# Altium project smart_pill_box.PrjPcb
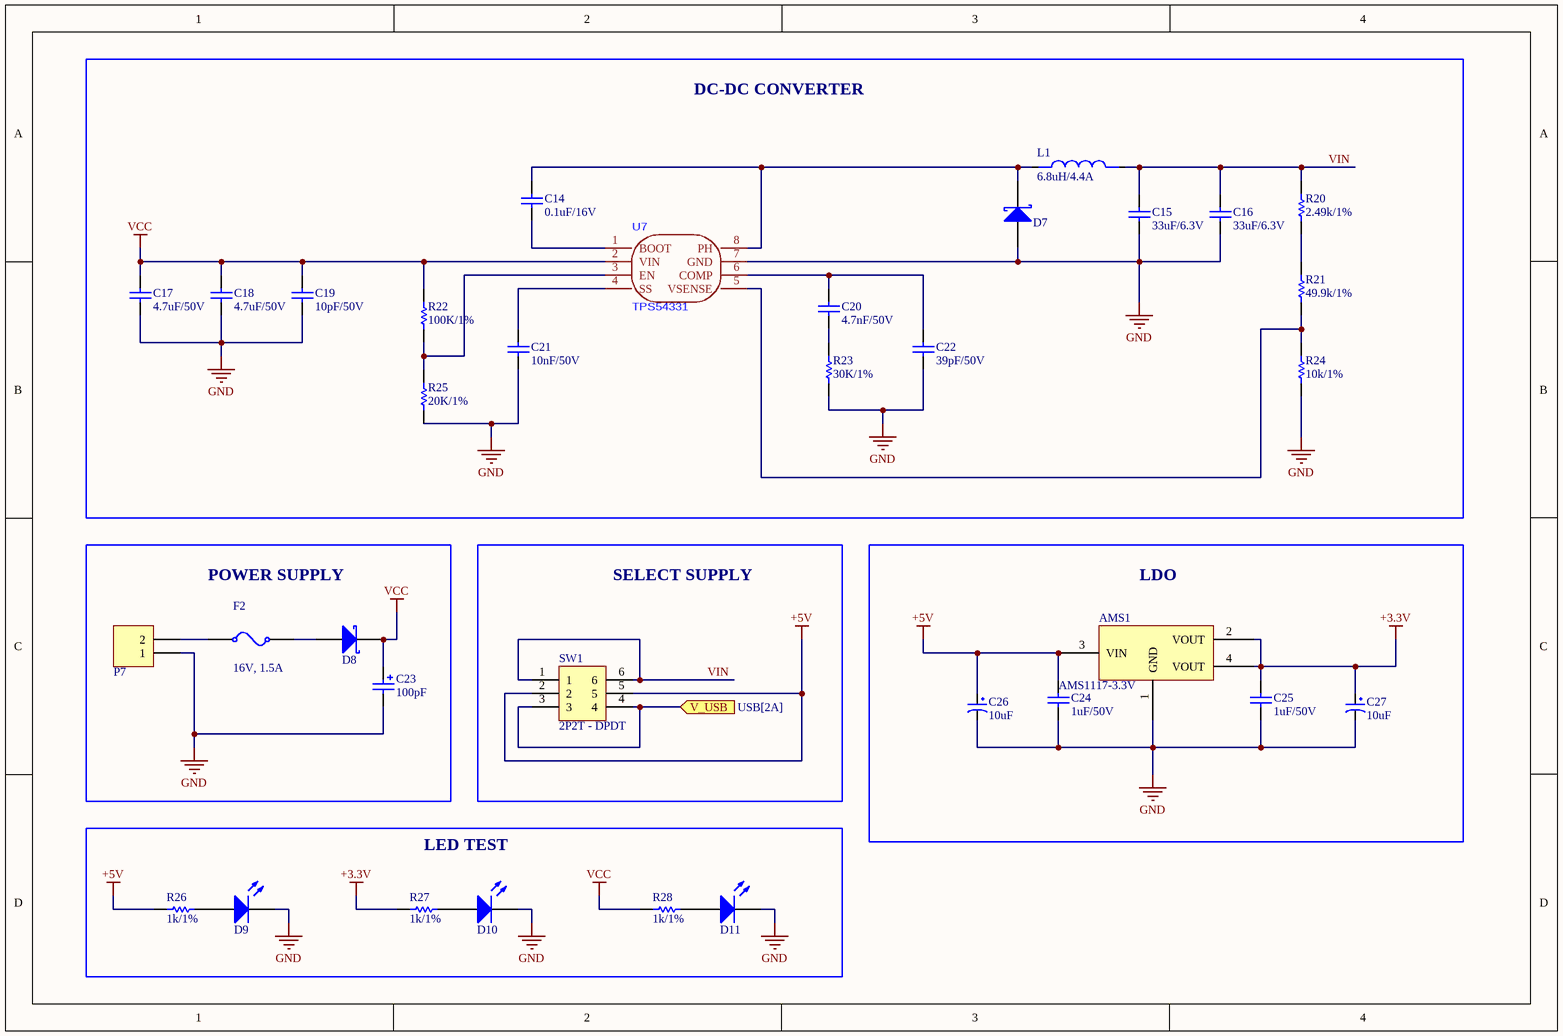
[diagram p0: Power.SchDoc]
9 sheets, 103 parts. Net scope: flat (ports and power ports of the same name join across sheets).
Board file: smart_pill_box.PcbDoc
Sheets:
  CoverPage.SchDoc
  Index.SchDoc
  PowerTree.SchDoc
  BlockDiagram.SchDoc
  Power.SchDoc
  ESP32.SchDoc
  USB.SchDoc
  Input.SchDoc
  Output.SchDoc

## Sheet CoverPage.SchDoc
size A; SheetNumber: 1; SheetTotal: 5

## Sheet Index.SchDoc
size A; SheetNumber: 2; SheetTotal: 6

## Sheet PowerTree.SchDoc
size A; SheetNumber: 3; SheetTotal: 7

## Sheet BlockDiagram.SchDoc
size A; SheetNumber: 4; SheetTotal: 8

## Sheet Power.SchDoc
size A4; SheetNumber: 5; SheetTotal: 9

### Parts
AMS1  AMS1117-3.3V  [SOT223]
C14  value 0.1uF/16V  [CAP-SM-0805]  (hidden comment: Cap Non-Pol SMD)
C15  value 33uF/6.3V  [CAP-SM-0805]  (hidden comment: Cap Non-Pol SMD)
C16  value 33uF/6.3V  [CAP-SM-0805]  (hidden comment: Cap Non-Pol SMD)
C17  value 4.7uF/50V  [CAP-SM-0805]  (hidden comment: Cap Non-Pol SMD)
C18  value 4.7uF/50V  [CAP-SM-0805]  (hidden comment: Cap Non-Pol SMD)
C19  value 10pF/50V  [CAP-SM-0805]  (hidden comment: Cap Non-Pol SMD)
C20  value 4.7nF/50V  [CAP-SM-0805]  (hidden comment: Cap Non-Pol SMD)
C21  value 10nF/50V  [CAP-SM-0805]  (hidden comment: Cap Non-Pol SMD)
C22  value 39pF/50V  [CAP-SM-0805]  (hidden comment: Cap Non-Pol SMD)
C23  value 100pF  [CP1/2]  (hidden comment: Cap Pol)
C24  value 1uF/50V  [CAP-SM-0805]  (hidden comment: Cap Non-Pol SMD)
C25  value 1uF/50V  [CAP-SM-0805]  (hidden comment: Cap Non-Pol SMD)
C26  10uF  [tu hoa 4mm]
C27  10uF  [tu hoa 4mm]
D7  D Schottky  [SS34]  (value not drawn)
D8  D Schottky  [SS34]  (value not drawn)
D9  LED SMD  [LED_0805_Blue]  (value not drawn)
D10  LED SMD  [LED_0805_Blue]  (value not drawn)
D11  LED SMD  [LED_0805_Blue]  (value not drawn)
F2  16V, 1.5A  [Fuse_SMD_1812]
L1  6.8uH/4.4A  [CUON CAM SMD 0530]
P7  Header 2  [JP2]  (value not drawn)
R20  value 2.49k/1%  [RES-SM-0805]  (hidden comment: RESISTOR SMD)
R21  value 49.9k/1%  [RES-SM-0805]  (hidden comment: RESISTOR SMD)
R22  value 100K/1%  [RES-SM-0805]  (hidden comment: RESISTOR SMD)
R23  value 30K/1%  [RES-SM-0805]  (hidden comment: RESISTOR SMD)
R24  value 10k/1%  [RES-SM-0805]  (hidden comment: RESISTOR SMD)
R25  value 20K/1%  [RES-SM-0805]  (hidden comment: RESISTOR SMD)
R26  value 1k/1%  [RES-SM-0805]  (hidden comment: RESISTOR SMD)
R27  value 1k/1%  [RES-SM-0805]  (hidden comment: RESISTOR SMD)
R28  value 1k/1%  [RES-SM-0805]  (hidden comment: RESISTOR SMD)
SW1  2P2T - DPDT  [SW_2P2T-DPDT_SMD]
U7  TPS54331  [SO-8 TSP5430D]

### Blocks framed on the sheet
DC-DC CONVERTER: C14-C22 D7 L1 R20-R25 U7
POWER SUPPLY: C23 D8 F2 P7
SELECT SUPPLY: SW1
LDO: AMS1 C24-C27
LED TEST: D9-D11 R26-R28

### Ports
V_USB (in, see USB[2A])

### Nets
+3.3V: AMS1.2(VOUT) AMS1.4(VOUT) C25.2 C27.1 R27.1
+5V: AMS1.3(VIN) C24.2 C26.1 R26.1 SW1.2 SW1.5
GND: AMS1.1(GND) C15.2 C16.2 C17.1 C18.1 C19.1 C21.1 C22.2 C23.2 C24.1 C25.1 C26.2 C27.2 D7.1(A) D9.2(K) D10.2(K) D11.2(K) P7.1 R23.2 R24.2 R25.2 U7.7(GND)
VCC: C17.2 C18.2 C19.2 C23.1 D8.2(K) R22.1 R28.1 U7.2(VIN)
VIN: C15.1 C16.1 L1.2 R20.1 SW1.1 SW1.6
NetC7_1: SW1.3 SW1.4 ; port V_USB
NetC14_1: C14.1 U7.1(BOOT)
NetC14_2: C14.2 D7.2(K) L1.1 U7.8(PH)
NetC20_1: C20.1 C22.1 U7.6(COMP)
NetC20_2: C20.2 R23.1
NetC21_2: C21.2 U7.4(SS)
NetD8_1: D8.1(A) F2.1
NetD9_1: D9.1(A) R26.2
NetD10_1: D10.1(A) R27.2
NetD11_1: D11.1(A) R28.2
NetF2_0: F2.0 P7.2
NetR20_2: R20.2 R21.1
NetR21_2: R21.2 R24.1 U7.5(VSENSE)
NetR22_2: R22.2 R25.1 U7.3(EN)

### Library data of the parts
AMS1 = AMS1117 SMD: Dán; Value: AMS1117-3.3V SOT223; Don_Vi: Con; Ma_Hang: MH000596; Ghi_Chu: *; Kieu_Chan: *; Chung_Loai: Dán
C14-C22 C24 C25 = Cap Non-Pol SMD: Capacitor
C23 = Cap Pol: Polarized Capacitor (Radial)
C26 C27 = Tu Hoa 10uF 25V 4x7: Cắm; So_Chan: 2; Ten_Linh_Kien: Tụ Hóa 10uF 25V 4x7MM; Don_Vi: Con; Ma_Hang: MH001349; Chung_Loai: Cắm; Kieu_Chan: *
D7 D8 = D Schottky: Schottky Diode; Published: 8-Jun-2000; LatestRevisionDate: 17-Jul-2002; LatestRevisionNote: Re-released for DXP Platform.; PackageReference: SMB; Publisher: Altium Limited; PackageDescription: DO-214-AA/SMB; 2 C-Bend Leads; Body 5.3 x 3.6 mm, inc. leads (LxW); Code_JEDEC: DO-214-AA
D9-D11 = LED SMD: LED
F2 = 061812150024: Resettable Fuse, Size 1812, 24V, 1.5A; Manufacturer: Littelfuse; Threshold Current: 20A; Trip Current: 3A; Threshold Voltage: 24V; Hold Current: 1.5A; Size: 1812; Mounting Technology: SMT/SMD; ComponentLink1Description: Datasheet link; ComponentLink1URL: https://www.littelfuse.com/~/media/electronics/product_specifications/resettable_ptcs/littelfuse_ptc_minismdc300f_2_product_specification.pdf.pdf; ComponentLink2Description: Supplier 1 URL; ComponentLink2URL: https://www.mouser.vn/ProductDetail/Littelfuse/MINISMDC150F-24-2?qs=F6FIpiMdEVZ%2Fp37J%2FDHAxA%3D%3D; ComponentLink3Description: Supplier 2 URL; ComponentLink3URL: https://www.digikey.com/en/products/detail/littelfuse-inc/MINISMDC150F-24-2/1113513?s=N4IgTCBcDaILIEkByCDKcAiBhAjAVgAYAxAejABYBaCAXQF8g; ComponentLink4Description: Supplier 3 URL; ComponentLink4URL: https://www.thegioiic.com/cau-chi-tu-phuc-hoi-1812-24v-1-5a; Supplier 1 Name: Mouser; Supplier 1 SN: 650-MINISMDC150F/24; Supplier 1 URL: https://www.mouser.vn/ProductDetail/Littelfuse/MINISMDC150F-24-2?qs=F6FIpiMdEVZ%2Fp37J%2FDHAxA%3D%3D; Supplier 2 Name: Digi-Key; Supplier 2 SN: MINISMDC150F24-2TR-ND; Supplier 2 URL: https://www.mouser.vn/ProductDetail/Littelfuse/MINISMDC150F-24-2?qs=F6FIpiMdEVZ%2Fp37J%2FDHAxA%3D%3D; Supplier 3 Name: thegioiic; Supplier 3 SN: N/A; Supplier 3 URL: https://www.thegioiic.com/cau-chi-tu-phuc-hoi-1812-24v-1-5a; Value: 24V, 1.5A
L1 = Cuon Cam SMD 0530: SMD 0530; MP: FDV0530-H-1R5M=P3; Package: None; Price: None; Value: *; Availability: Unavailable
P7 = Header 2: Header, 2-Pin; LatestRevisionDate: 17-Jul-2002; LatestRevisionNote: Re-released for DXP Platform.; Publisher: Altium Limited
R20-R28 = RESISTOR SMD: Resistor
SW1 = SW2_0.3A-2P2T- DPDT-SMD: PCB Mountable Slide Switch. Double Pole, Double Throw = DPDT; Manufacturer: NA; Manufacturer Part Number: NA; Supplier-1: Sunrom; Supplier Part Number-1: 5261; Case/Package: SMD; Alternate Part Number-1: NA

## Sheet ESP32.SchDoc
size A; SheetNumber: 6; SheetTotal: 9
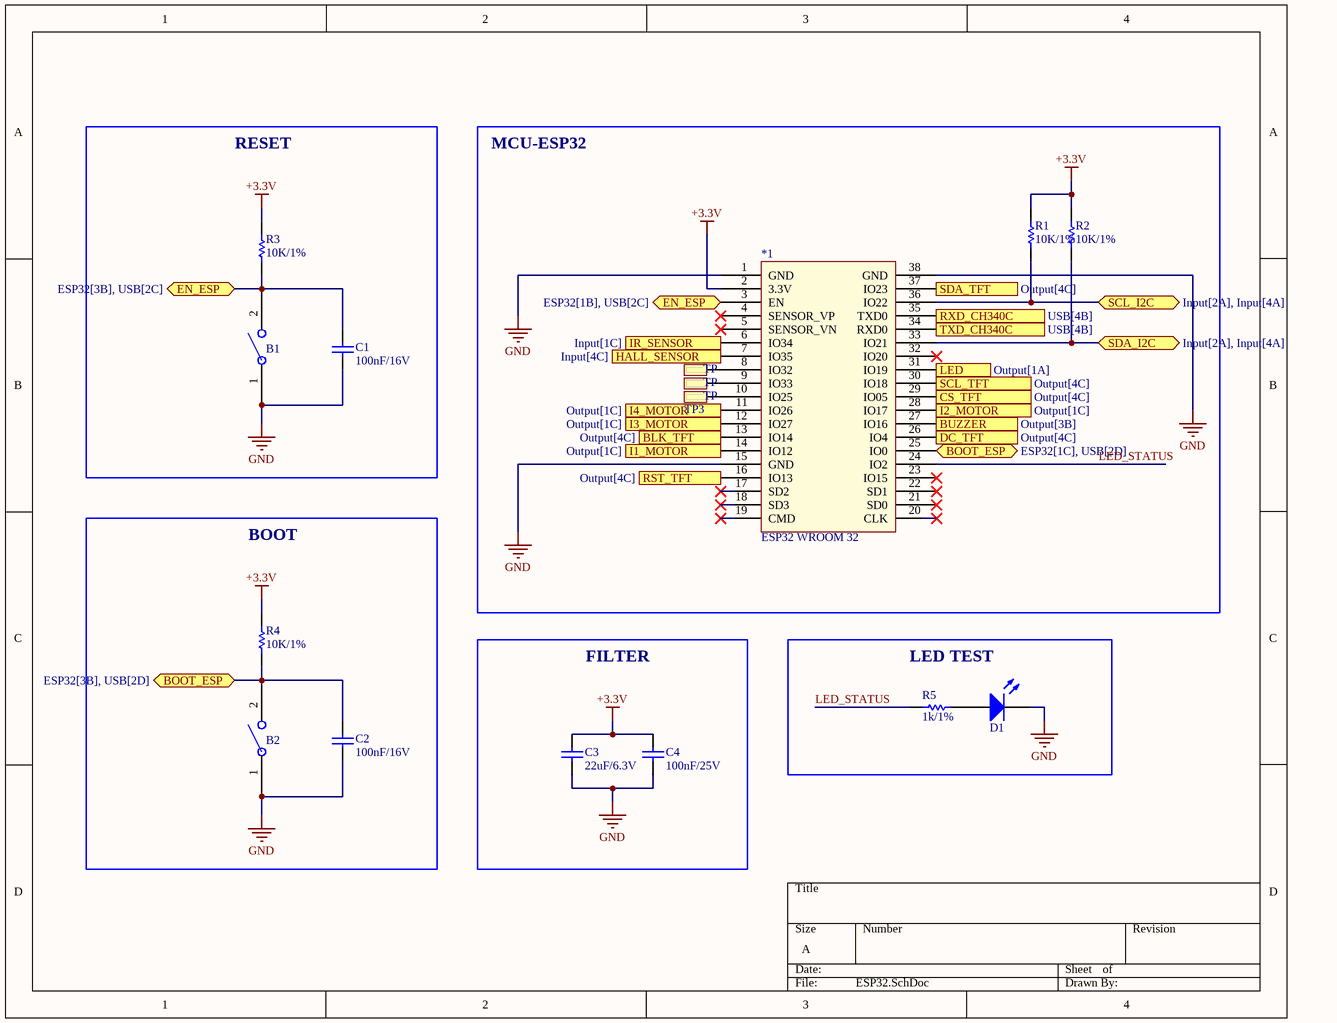
[diagram p1: ESP32.SchDoc]

### Parts
*1  ESP32 WROOM 32  [ESP32-WROOM-32D]
B1  Button SMD 2 Pin 3x4mm  [BUTTON SMD 2 PIN]  (value not drawn)
B2  Button SMD 2 Pin 3x4mm  [BUTTON SMD 2 PIN]  (value not drawn)
C1  value 100nF/16V  [CAP-SM-0805]  (hidden comment: Cap Non-Pol SMD)
C2  value 100nF/16V  [CAP-SM-0805]  (hidden comment: Cap Non-Pol SMD)
C3  value 22uF/6.3V  [CAP-SM-0805]  (hidden comment: Cap Non-Pol SMD)
C4  value 100nF/25V  [CAP-SM-0805]  (hidden comment: Cap Non-Pol SMD)
D1  LED SMD  [LED_0805_Blue]  (value not drawn)
R1  value 10K/1%  [RES-SM-0805]  (hidden comment: RESISTOR SMD)
R2  value 10K/1%  [RES-SM-0805]  (hidden comment: RESISTOR SMD)
R3  value 10K/1%  [RES-SM-0805]  (hidden comment: RESISTOR SMD)
R4  value 10K/1%  [RES-SM-0805]  (hidden comment: RESISTOR SMD)
R5  value 1k/1%  [RES-SM-0805]  (hidden comment: RESISTOR SMD)
TP1  Test Point  [TP]  (value not drawn)
TP2  Test Point  [TP]  (value not drawn)
TP3  Test Point  [TP]  (value not drawn)

### Blocks framed on the sheet
RESET: B1 C1 R3
MCU-ESP32: *1 R1 R2 TP1-TP3
BOOT: B2 C2 R4
FILTER: C3 C4
LED TEST: D1 R5

### Ports
BLK_TFT (out, see Output[4C]), BOOT_ESP (bidir, see ESP32[1C], USB[2D]), BOOT_ESP (bidir, see ESP32[3B], USB[2D]), BUZZER (out, see Output[3B]), CS_TFT (out, see Output[4C]), DC_TFT (out, see Output[4C]), EN_ESP (bidir, see ESP32[1B], USB[2C]), EN_ESP (bidir, see ESP32[3B], USB[2C]), HALL_SENSOR (in, see Input[4C]), I1_MOTOR (out, see Output[1C]), I2_MOTOR (out, see Output[1C]), I3_MOTOR (out, see Output[1C]), I4_MOTOR (out, see Output[1C]), IR_SENSOR (in, see Input[1C]), LED (out, see Output[1A]), RST_TFT (out, see Output[4C]), RXD_CH340C (out, see USB[4B]), SCL_I2C (bidir, see Input[2A], Input[4A]), SCL_TFT (out, see Output[4C]), SDA_I2C (bidir, see Input[2A], Input[4A]), SDA_TFT (out, see Output[4C]), TXD_CH340C (in, see USB[4B])

### Nets
+3.3V: *1.2(3.3V) C3.2 C4.2 R1.1 R2.1 R3.1 R4.1
GND: *1.1(GND) *1.15(GND) *1.38(GND) B1.1 B2.1 C1.1 C2.1 C3.1 C4.1 D1.2(K)
LED_STATUS: *1.24(IO2) R5.1
Net*1_3: *1.3(EN) B1.2 C1.2 R3.2 ; port EN_ESP
Net*1_6: *1.6(IO34) ; port IR_SENSOR
Net*1_7: *1.7(IO35) ; port HALL_SENSOR
Net*1_8: *1.8(IO32) TP1.TP1
Net*1_9: *1.9(IO33) TP2.TP1
Net*1_10: *1.10(IO25) TP3.TP1
Net*1_11: *1.11(IO26) ; port I4_MOTOR
Net*1_12: *1.12(IO27) ; port I3_MOTOR
Net*1_13: *1.13(IO14) ; port BLK_TFT
Net*1_14: *1.14(IO12) ; port I1_MOTOR
Net*1_16: *1.16(IO13) ; port RST_TFT
Net*1_25: *1.25(IO0) B2.2 C2.2 R4.2 ; port BOOT_ESP
Net*1_26: *1.26(IO4) ; port DC_TFT
Net*1_27: *1.27(IO16) ; port BUZZER
Net*1_28: *1.28(IO17) ; port I2_MOTOR
Net*1_29: *1.29(IO05) ; port CS_TFT
Net*1_30: *1.30(IO18) ; port SCL_TFT
Net*1_31: *1.31(IO19) ; port LED
Net*1_33: *1.33(IO21) R2.2 ; port SDA_I2C
Net*1_34: *1.34(RXD0) ; port TXD_CH340C
Net*1_35: *1.35(TXD0) ; port RXD_CH340C
Net*1_36: *1.36(IO22) R1.2 ; port SCL_I2C
Net*1_37: *1.37(IO23) ; port SDA_TFT
NetD1_1: D1.1(A) R5.2

Not connected (* = marked no-connect by the designer): *1 4(SENSOR_VP)* 5(SENSOR_VN)* 17(SD2)* 18(SD3)* 19(CMD)* 20(CLK)* 21(SD0)* 22(SD1)* 23(IO15)* 32(IO20)*

### Notes on the sheet
- (in symbol Test Point) TP

### Library data of the parts
B1 B2 = BUTTON
C1-C4 = Cap Non-Pol SMD: Capacitor
D1 = LED SMD: LED
R1-R5 = RESISTOR SMD: Resistor

## Sheet USB.SchDoc
size A; SheetNumber: 7; SheetTotal: 9
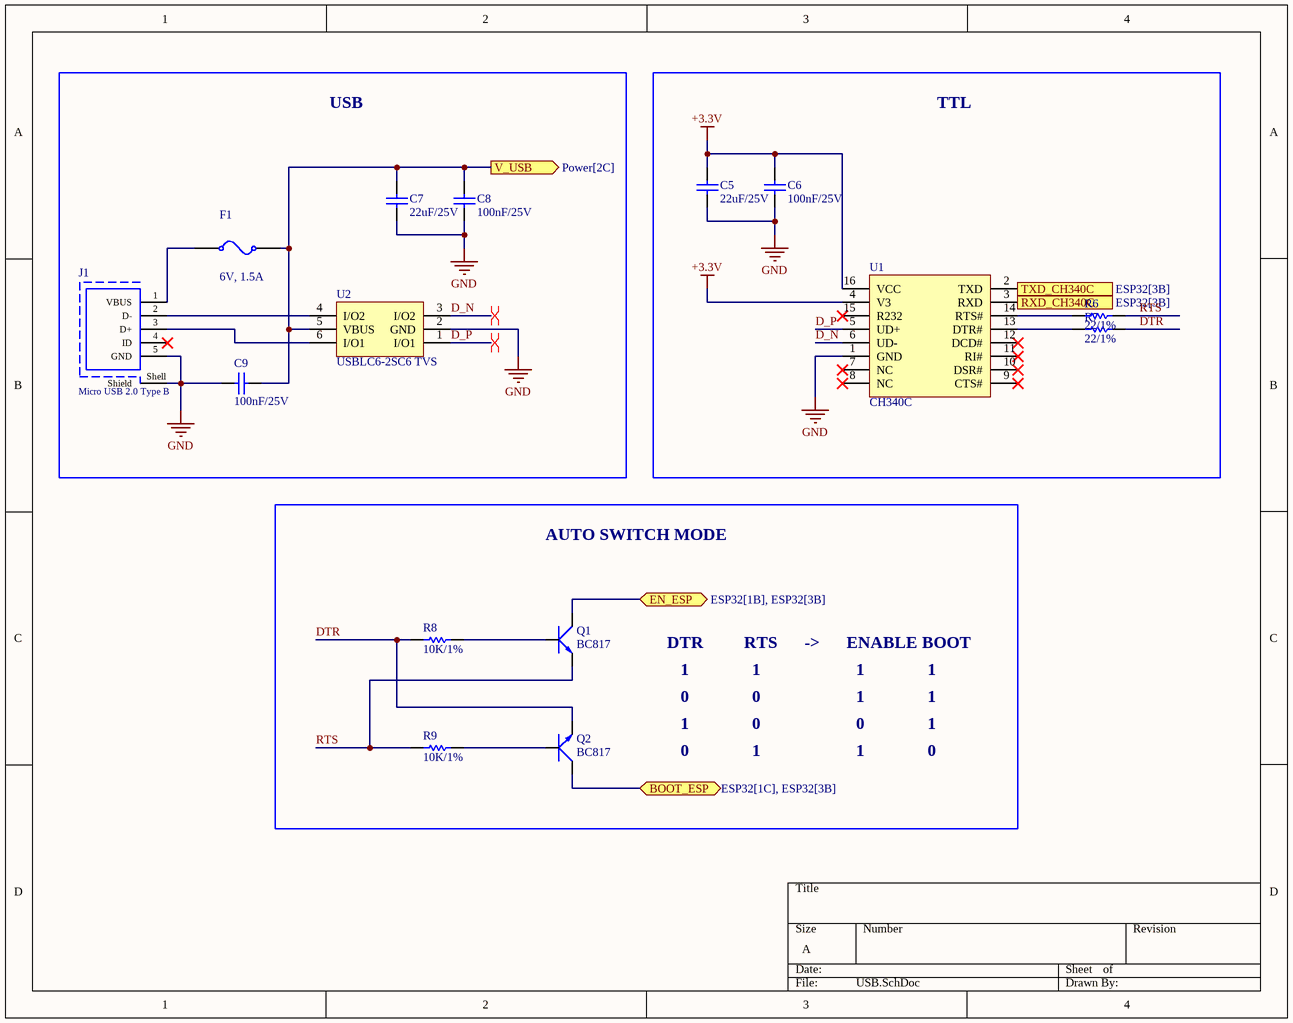
[diagram p2: USB.SchDoc]

### Parts
C5  value 22uF/25V  [CAP-SM-0805]  (hidden comment: Cap Non-Pol SMD)
C6  value 100nF/25V  [CAP-SM-0805]  (hidden comment: Cap Non-Pol SMD)
C7  value 22uF/25V  [CAP-SM-0805]  (hidden comment: Cap Non-Pol SMD)
C8  value 100nF/25V  [CAP-SM-0805]  (hidden comment: Cap Non-Pol SMD)
C9  value 100nF/25V  [CAP-SM-0805]  (hidden comment: Cap Non-Pol SMD)
F1  6V, 1.5A  [Fuse_SMD_1812]
J1  Micro USB 2.0 Type B  [629105150521]
Q1  BC817  [SOT-23]
Q2  BC817  [SOT-23]
R6  value 22/1%  [RES-SM-0805]  (hidden comment: RESISTOR SMD)
R7  value 22/1%  [RES-SM-0805]  (hidden comment: RESISTOR SMD)
R8  value 10K/1%  [RES-SM-0805]  (hidden comment: RESISTOR SMD)
R9  value 10K/1%  [RES-SM-0805]  (hidden comment: RESISTOR SMD)
U1  CH340C  [SOIC16_50_284_25X90_SMT]
U2  USBLC6-2SC6 TVS  [SOT23-6]

### Blocks framed on the sheet
USB: C7-C9 F1 J1 U2

### Ports
BOOT_ESP (bidir, see ESP32[1C], ESP32[3B]), EN_ESP (bidir, see ESP32[1B], ESP32[3B]), RXD_CH340C (in, see ESP32[3B]), TXD_CH340C (out, see ESP32[3B]), V_USB (out, see Power[2C])

### Nets
+3.3V: C5.1 C6.1 U1.4(V3) U1.16(VCC)
GND: C5.2 C6.2 C7.2 C8.2 C9.1 J1.5(GND) J1.Shell(Shield) U1.1(GND) U2.2(GND)
D_N: U1.6(UD-) U2.3(I/O2)
D_P: U1.5(UD+) U2.1(I/O1)
DTR: Q2.2(E) R7.2 R8.1
RTS: Q1.2(E) R6.2 R9.1
Net*1_3: Q1.3(C) ; port EN_ESP
Net*1_25: Q2.3(C) ; port BOOT_ESP
Net*1_34: U1.2(TXD) ; port TXD_CH340C
Net*1_35: U1.3(RXD) ; port RXD_CH340C
NetC7_1: C7.1 C8.1 C9.2 F1.1 U2.5(VBUS) ; port V_USB
NetF1_0: F1.0 J1.1(VBUS)
NetJ1_2: J1.2(D-) U2.4(I/O2)
NetJ1_3: J1.3(D+) U2.6(I/O1)
NetQ1_1: Q1.1(B) R8.2
NetQ2_1: Q2.1(B) R9.2
NetR6_1: R6.1 U1.14(RTS#)
NetR7_1: R7.1 U1.13(DTR#)

Not connected (* = marked no-connect by the designer): J1 4(ID)*; U1 7(NC)* 8(NC)* 9(CTS#)* 10(DSR#)* 11(RI#)* 12(DCD#)* 15(R232)*

### Layout directives
differential pair: D_N, D_P

### Notes on the sheet
- TTL
- AUTO SWITCH MODE
- DTR         RTS      ->      ENABLE BOOT
- 1              1
- 0              0
- 1              0
- 0              1

### Library data of the parts
C5-C9 = Cap Non-Pol SMD: Capacitor
F1 = 061812150024: as F2 on sheet Power; Threshold Voltage: 24V; Hold Current: 1.5A; Size: 1812; Mounting Technology: SMT/SMD; ComponentLink1Description: Datasheet link; ComponentLink1URL: https://www.littelfuse.com/~/media/electronics/product_specifications/resettable_ptcs/littelfuse_ptc_minismdc300f_2_product_specification.pdf.pdf; ComponentLink2Description: Supplier 1 URL; ComponentLink2URL: https://www.mouser.vn/ProductDetail/Littelfuse/MINISMDC150F-24-2?qs=F6FIpiMdEVZ%2Fp37J%2FDHAxA%3D%3D; ComponentLink3Description: Supplier 2 URL; ComponentLink3URL: https://www.digikey.com/en/products/detail/littelfuse-inc/MINISMDC150F-24-2/1113513?s=N4IgTCBcDaILIEkByCDKcAiBhAjAVgAYAxAejABYBaCAXQF8g; ComponentLink4Description: Supplier 3 URL; ComponentLink4URL: https://www.thegioiic.com/cau-chi-tu-phuc-hoi-1812-24v-1-5a; Supplier 1 Name: Mouser; Supplier 1 SN: 650-MINISMDC150F/24; Supplier 1 URL: https://www.mouser.vn/ProductDetail/Littelfuse/MINISMDC150F-24-2?qs=F6FIpiMdEVZ%2Fp37J%2FDHAxA%3D%3D; Supplier 2 Name: Digi-Key; Supplier 2 SN: MINISMDC150F24-2TR-ND; Supplier 2 URL: https://www.mouser.vn/ProductDetail/Littelfuse/MINISMDC150F-24-2?qs=F6FIpiMdEVZ%2Fp37J%2FDHAxA%3D%3D; Supplier 3 Name: thegioiic; Supplier 3 SN: N/A; Supplier 3 URL: https://www.thegioiic.com/cau-chi-tu-phuc-hoi-1812-24v-1-5a; Value: 24V, 1.5A
J1 = 629105150521: Micro USB 2.0 Type B Receptacle WR-COM, Horizontal, SMT, with Pegs, High Current at Pin 1 & Pin 5; Rated Current: 3 A; Contact Resistance: 30 mOhm; Working Voltage: 30 VAC; ComponentLink1Description: Datasheet; ComponentLink1URL: https://katalog.we-online.de/em/datasheet/629105150521.pdf; ComponentLink2Description: Supplier 1 URL; ComponentLink2URL: N/A; Part Number: 629105150521; Published Date: September 2018; Publisher: Wurth Elektronik; Orientation: Horizontal; Connector Type: Micro USB 2.0 Type B; Operating Temperature: -40 to 85 degC; Mounting Technology: SMT; Gender: Receptacle; Packaging: Tape and Reel; ComponentLink3Description: Supplier 2 URL; ComponentLink3URL: N/A; ComponentLink4Description: Supplier 3 URL; ComponentLink4URL: N/A; Supplier 1 Name: Mouser; Supplier 1 SN: 710-629105150521; Supplier 1 URL: https://www.mouser.vn/ProductDetail/Wurth-Elektronik/629105150521?qs=a9WhcLg8qCzXiH7kZP8GRQ%3D%3D; Supplier 2 Name: Digi-Key; Supplier 2 SN: N/A; Supplier 2 URL: N/A; Supplier 3 Name: thegioiic; Supplier 3 SN: N/A; Supplier 3 URL: N/A; Value: Micro USB 2.0 Type B
Q1 Q2 = Trans BC817: SOT-23 - C8658; Value: C9014
R6-R9 = RESISTOR SMD: Resistor
U1 = CH340C: USB Bridge, USB to UART USB 2.0 UART Interface; Manufacturer: Olimex; Alternate Part Number-1: NA; Manufacturer Part Number: CH340C; Case/Package: SOIC16; Supplier-1: LCSC; Supplier Part Number-1: C84681
U2 = IC_LTC6992IS6-1: Oscillator, Silicon IC 3.81Hz ~ 1MHz TSOT-23-6; Manufacturer: Linear Technology/Analog Devices; Alternate Part Number-1: NA; Manufacturer Part Number: LTC6992IS6-1; Case/Package: SOT-23-6; Supplier-1: Arrow; Supplier Part Number-1: LTC6992IS6-1#TRMPBF

## Sheet Input.SchDoc
size A4; SheetNumber: 8; SheetTotal: 9
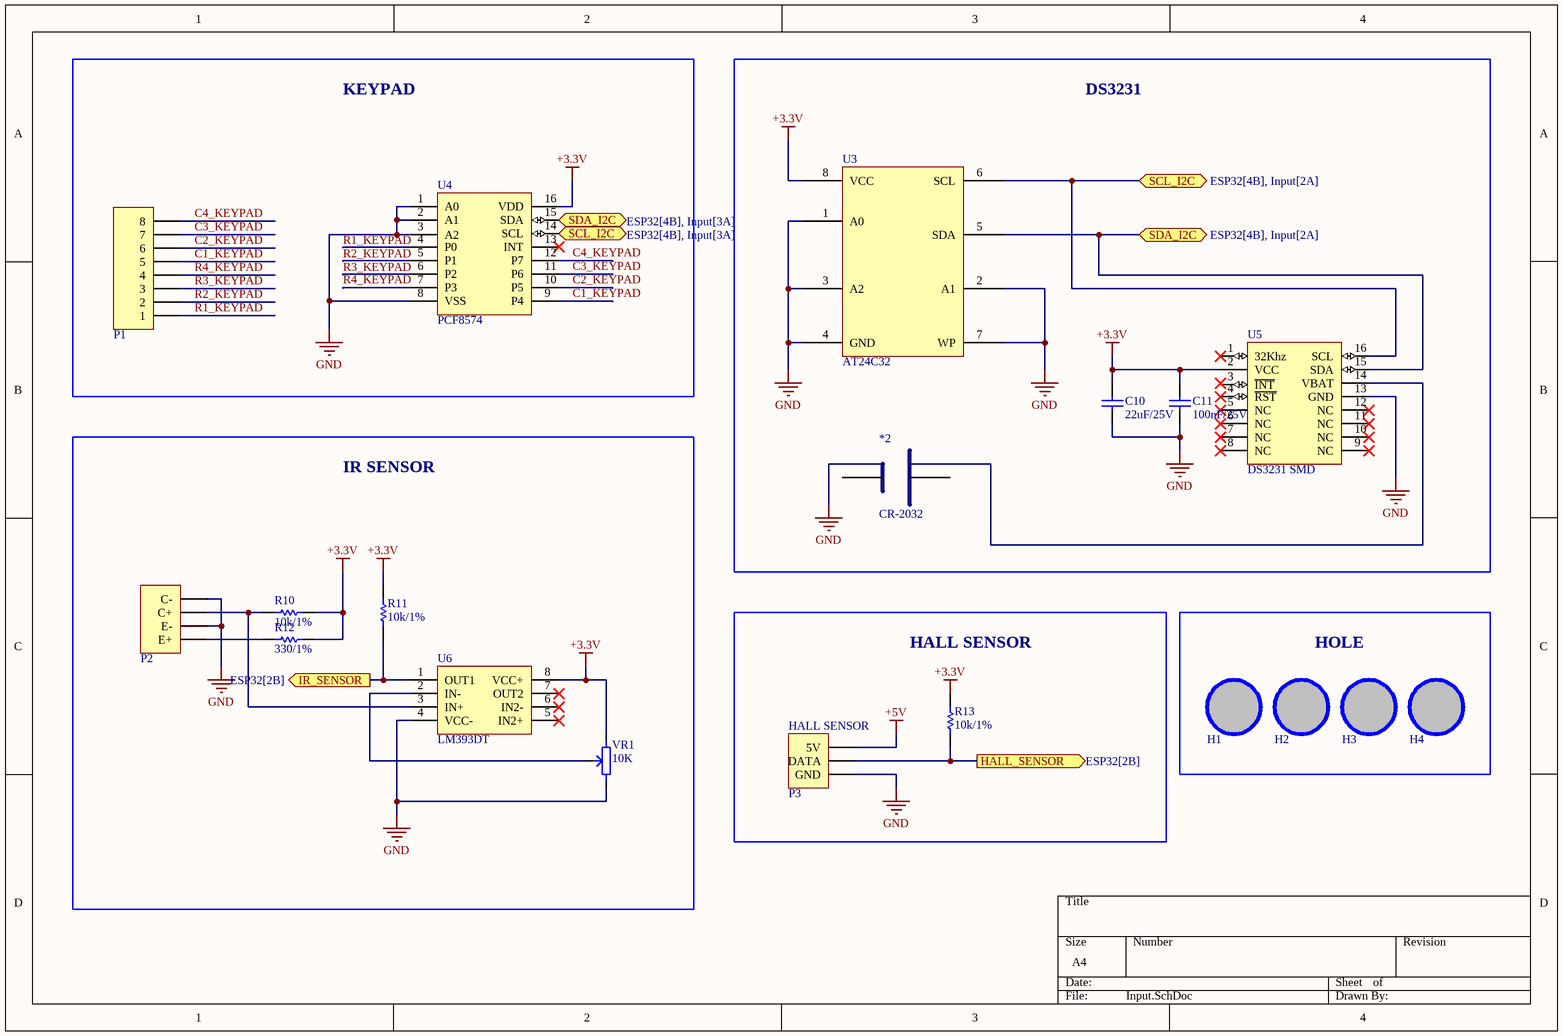
[diagram p3: Input.SchDoc]

### Parts
*2  CR-2032  [CR-2032]
C10  value 22uF/25V  [CAP-SM-0805]  (hidden comment: Cap Non-Pol SMD)
C11  value 100nF/25V  [CAP-SM-0805]  (hidden comment: Cap Non-Pol SMD)
H1  Hole  [LO KHOAN 3MM]  (value not drawn)
H2  Hole  [LO KHOAN 3MM]  (value not drawn)
H3  Hole  [LO KHOAN 3MM]  (value not drawn)
H4  Hole  [LO KHOAN 3MM]  (value not drawn)
P1  Header 8  [JP8]  (value not drawn)
P2  Header 4  [JP4]  (value not drawn)
P3  HALL SENSOR  [JP3]
R10  value 10k/1%  [RES-SM-0805]  (hidden comment: RESISTOR SMD)
R11  value 10k/1%  [RES-SM-0805]  (hidden comment: RESISTOR SMD)
R12  value 330/1%  [RES-SM-0805]  (hidden comment: RESISTOR SMD)
R13  value 10k/1%  [RES-SM-0805]  (hidden comment: RESISTOR SMD)
U3  AT24C32  [LM555CMX]
U4  PCF8574  [SOIC 16]
U5  DS3231 SMD  [SOIC 16]
U6  LM393DT  [SOIC8_50_328_25X90_SMT]
VR1  10K  [Bien Tro Tam Giac Dung]

### Blocks framed on the sheet
KEYPAD: P1 U4
DS3231: *2 C10 C11 U3 U5
IR SENSOR: P2 R10-R12 U6 VR1
HALL SENSOR: P3 R13
HOLE: H1-H4

### Ports
HALL_SENSOR (out, see ESP32[2B]), IR_SENSOR (out, see ESP32[2B]), SCL_I2C (bidir, see ESP32[4B], Input[2A]), SCL_I2C (bidir, see ESP32[4B], Input[3A]), SDA_I2C (bidir, see ESP32[4B], Input[2A]), SDA_I2C (bidir, see ESP32[4B], Input[3A])

### Nets
+3.3V: C10.1 C11.1 R10.2 R11.2 R12.2 R13.2 U3.8(VCC) U4.16(VDD) U5.2(VCC) U6.8(VCC+) VR1.3
+5V: P3.1(5V)
GND: *2.2 C10.2 C11.2 P2.2(E-) P2.4(C-) P3.3(GND) U3.1(A0) U3.2(A1) U3.3(A2) U3.4(GND) U3.7(WP) U4.1(A0) U4.2(A1) U4.3(A2) U4.8(VSS) U5.13(GND) U6.4(VCC-) VR1.1
C1_KEYPAD: P1.5 U4.9(P4)
C2_KEYPAD: P1.6 U4.10(P5)
C3_KEYPAD: P1.7 U4.11(P6)
C4_KEYPAD: P1.8 U4.12(P7)
R1_KEYPAD: P1.1 U4.4(P0)
R2_KEYPAD: P1.2 U4.5(P1)
R3_KEYPAD: P1.3 U4.6(P2)
R4_KEYPAD: P1.4 U4.7(P3)
Net*1_6: R11.1 U6.1(OUT1) ; port IR_SENSOR
Net*1_7: P3.2(DATA) R13.1 ; port HALL_SENSOR
Net*1_33: U3.5(SDA) U4.15(SDA) U5.15(SDA) ; port SDA_I2C
Net*1_36: U3.6(SCL) U4.14(SCL) U5.16(SCL) ; port SCL_I2C
Net*2_1: *2.1 U5.14(VBAT)
NetP2_1: P2.1(E+) R12.1
NetP2_3: P2.3(C+) R10.1 U6.3(IN+)
NetU6_2: U6.2(IN-) VR1.2

Not connected (* = marked no-connect by the designer): H1 1; H2 1; H3 1; H4 1; U4 13(INT)*; U5 1(32Khz)* 3(~{INT}) 4(~{RST})* 5(NC)* 6(NC)* 7(NC)* 8(NC)* 9(NC)* 10(NC)* 11(NC)* 12(NC)*; U6 5(IN2+)* 6(IN2-)* 7(OUT2)*

### Library data of the parts
C10 C11 = Cap Non-Pol SMD: Capacitor
H1-H4 = Hole: Hole 3mm
P1 = Header 8: Header, 8-Pin; LatestRevisionDate: 17-Jul-2002; LatestRevisionNote: Re-released for DXP Platform.; Publisher: Altium Limited
P2 = Header 4: Header, 4-Pin; LatestRevisionDate: 17-Jul-2002; LatestRevisionNote: Re-released for DXP Platform.; Publisher: Altium Limited
P3 = Header 3: Header, 3-Pin; LatestRevisionDate: 17-Jul-2002; LatestRevisionNote: Re-released for DXP Platform.; Publisher: Altium Limited
R10-R13 = RESISTOR SMD: Resistor
U3 = LM555CMX: Timers & Support Products TIMER; Manufacturer: Texas Instruments; Manufacturer Part Number: LM555CMX/NOPB; Pad count: 8; Supply Voltage - Max: 4.5 V; Supply Voltage - Min: 16 V; Number of Internal Timers: 1; Power Dissipation: 1.18 W; Active: Active; ComponentLink1Description: Datasheet; ComponentLink1URL: https://www.ti.com/lit/gpn/lm555; LCSC Part #: N/A; Mount: SMD/SMT; Operating Temperature Max: + 85 C; Operating Temperature Min: - 40 C; Package / Case: SOIC-8; Packaging: Tape and Reel; Supplier 1: Mouser; Supplier 1 Part Number: 926-LM555CMX/NOPB; Supplier 1 URL: https://www.mouser.com/ProductDetail/Texas-Instruments/LM555CMX-NOPB?qs=QbsRYf82W3GHnQuoL%2FmIoA%3D%3D; Supplier 2: Digi-Key; Supplier 2 Part Number: N/A; Supplier 2 URL: N/A; Supplier 3: thegioiic; Supplier 3 Part Number: NE555D; Supplier 3 URL: https://www.thegioiic.com/ne555d-ic-timer-circuit-100khz-8-soic; Value: LM555CMX
U4 U5 = DS3231 SMD: SOIC
U6 = IC_LM393DT: Comparator General Purpose CMOS, DTL, ECL, MOS, Open-Collector, TTL 8-SO; Manufacturer: Texas Instruments; Alternate Part Number-1: NA; Manufacturer Part Number: LM393DT; Case/Package: SOIC8; Supplier-1: ARROW; Supplier Part Number-1: LM393DT
VR1 = Bien tro tam giac 10K Dung: Cắm; Ma_Hang: MH000919; Don_Vi: Con; Ten_Linh_Kien: Biến Trở Tam Giác 103-10K RM065 (Chân Đứng); Chung_Loai: Cắm; Kieu_Chan: *

## Sheet Output.SchDoc
size A; SheetNumber: 9; SheetTotal: 9
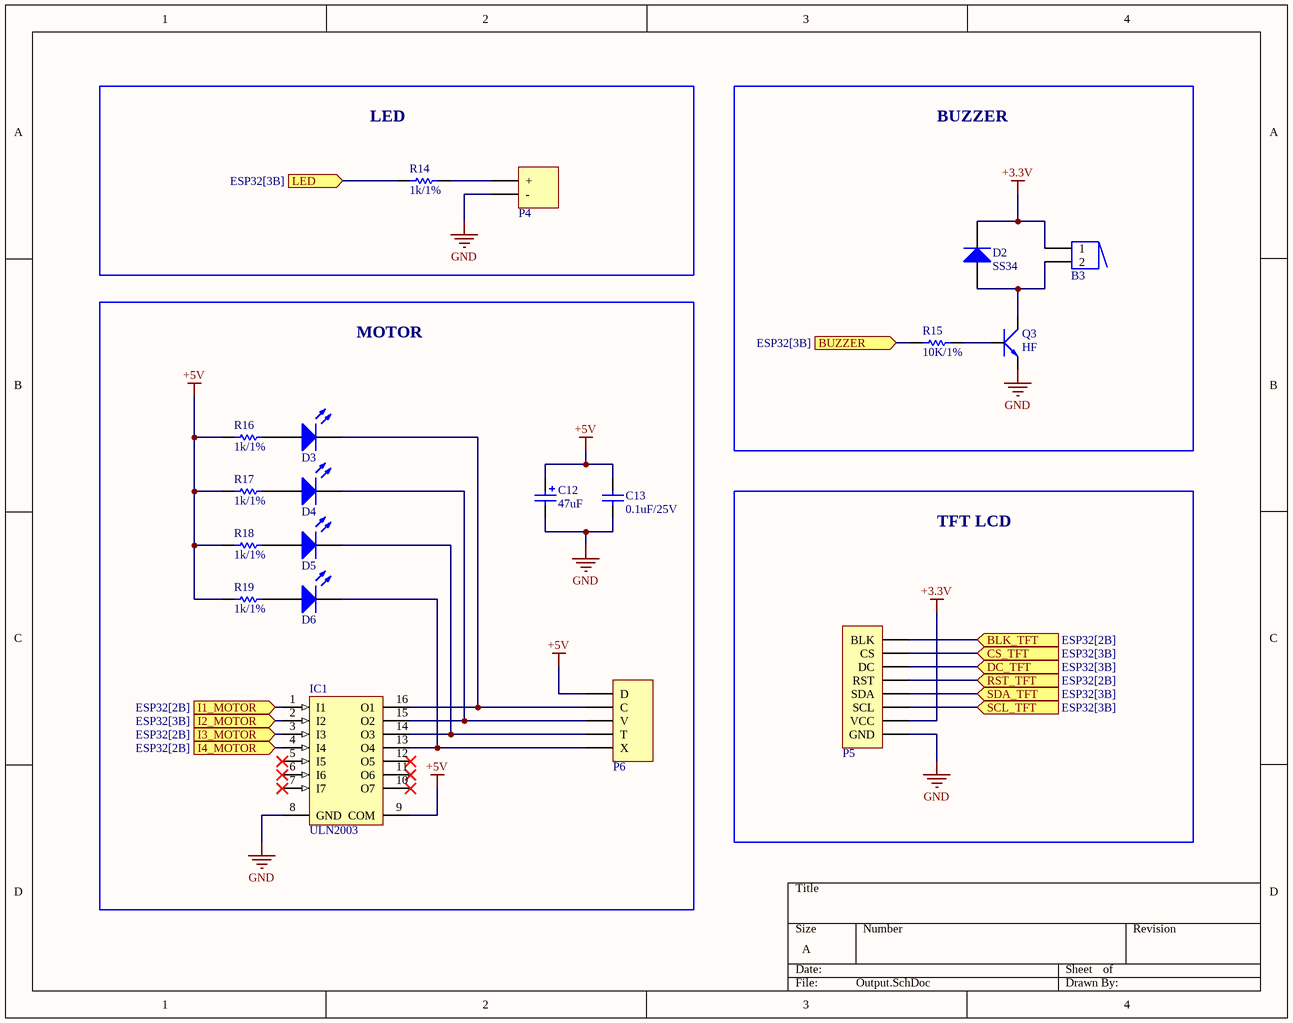
[diagram p4: Output.SchDoc]

### Parts
B3  Buzzer  [BUZZER]  (value not drawn)
C12  value 47uF  [CP1/2]  (hidden comment: Cap Pol)
C13  value 0.1uF/25V  [CAP-SM-0805]  (hidden comment: Cap Non-Pol SMD)
D2  SS34  [DIODE SMA]
D3  LED SMD  [LED_0805_Blue]  (value not drawn)
D4  LED SMD  [LED_0805_Blue]  (value not drawn)
D5  LED SMD  [LED_0805_Blue]  (value not drawn)
D6  LED SMD  [LED_0805_Blue]  (value not drawn)
IC1  ULN2003  [SOP 16]
P4  Header 2  [JP2]  (value not drawn)
P5  Header 8  [JP8]  (value not drawn)
P6  Header 5  [JP5]  (value not drawn)
Q3  HF  [SOT-23]
R14  value 1k/1%  [RES-SM-0805]  (hidden comment: RESISTOR SMD)
R15  value 10K/1%  [RES-SM-0805]  (hidden comment: RESISTOR SMD)
R16  value 1k/1%  [RES-SM-0805]  (hidden comment: RESISTOR SMD)
R17  value 1k/1%  [RES-SM-0805]  (hidden comment: RESISTOR SMD)
R18  value 1k/1%  [RES-SM-0805]  (hidden comment: RESISTOR SMD)
R19  value 1k/1%  [RES-SM-0805]  (hidden comment: RESISTOR SMD)

### Blocks framed on the sheet
LED: P4 R14
BUZZER: B3 D2 Q3 R15
MOTOR: C12 C13 D3-D6 IC1 P6 R16-R19
TFT LCD: P5

### Ports
BLK_TFT (in, see ESP32[2B]), BUZZER (in, see ESP32[3B]), CS_TFT (in, see ESP32[3B]), DC_TFT (in, see ESP32[3B]), I1_MOTOR (in, see ESP32[2B]), I2_MOTOR (in, see ESP32[3B]), I3_MOTOR (in, see ESP32[2B]), I4_MOTOR (in, see ESP32[2B]), LED (in, see ESP32[3B]), RST_TFT (in, see ESP32[2B]), SCL_TFT (in, see ESP32[3B]), SDA_TFT (in, see ESP32[3B])

### Nets
+3.3V: B3.1 D2.2(K) P5.7(VCC)
+5V: C12.1 C13.2 IC1.9(COM) P6.1(D) R16.1 R17.1 R18.1 R19.1
GND: C12.2 C13.1 IC1.8(GND) P4.2(-) P5.8(GND) Q3.2(E)
Net*1_11: IC1.4(I4) ; port I4_MOTOR
Net*1_12: IC1.3(I3) ; port I3_MOTOR
Net*1_13: P5.1(BLK) ; port BLK_TFT
Net*1_14: IC1.1(I1) ; port I1_MOTOR
Net*1_16: P5.4(RST) ; port RST_TFT
Net*1_26: P5.3(DC) ; port DC_TFT
Net*1_27: R15.1 ; port BUZZER
Net*1_28: IC1.2(I2) ; port I2_MOTOR
Net*1_29: P5.2(CS) ; port CS_TFT
Net*1_30: P5.6(SCL) ; port SCL_TFT
Net*1_31: R14.1 ; port LED
Net*1_37: P5.5(SDA) ; port SDA_TFT
NetB3_2: B3.2 D2.1(A) Q3.3(C)
NetD3_1: D3.1(A) R16.2
NetD3_2: D3.2(K) IC1.16(O1) P6.2(C)
NetD4_1: D4.1(A) R17.2
NetD4_2: D4.2(K) IC1.15(O2) P6.3(V)
NetD5_1: D5.1(A) R18.2
NetD5_2: D5.2(K) IC1.14(O3) P6.4(T)
NetD6_1: D6.1(A) R19.2
NetD6_2: D6.2(K) IC1.13(O4) P6.5(X)
NetP4_1: P4.1(+) R14.2
NetQ3_1: Q3.1(B) R15.2

Not connected (* = marked no-connect by the designer): IC1 5(I5)* 6(I6)* 7(I7)* 10(O7)* 11(O6)* 12(O5)*

### Library data of the parts
C12 = Cap Pol: Polarized Capacitor (Radial)
C13 = Cap Non-Pol SMD: Capacitor
D2 = Diode SS34 ( 1N5822 ): Dán; Don_Vi: Con; Ma_Hang: MH002104; Ten_Linh_Kien: Diode SS34 3A 40V SMA ( 1N5822 SS34A); Kieu_Chan: *; Chung_Loai: Dán
D3-D6 = LED SMD: LED
IC1 = ULN2003A SMD: Dán; Ten_Linh_Kien: ULN2003 SOP16; Don_Vi: Con; Ma_Hang: MH002408; Ghi_Chu: *; Chung_Loai: Dán; Kieu_Chan: *
P4 = Header 2: Header, 2-Pin; LatestRevisionDate: 17-Jul-2002; LatestRevisionNote: Re-released for DXP Platform.; Publisher: Altium Limited
P5 = Header 8: Header, 8-Pin; LatestRevisionDate: 17-Jul-2002; LatestRevisionNote: Re-released for DXP Platform.; Publisher: Altium Limited
P6 = Header 5: Header, 5-Pin; LatestRevisionDate: 17-Jul-2002; LatestRevisionNote: Re-released for DXP Platform.; Publisher: Altium Limited
Q3 = Trans C1815 HF SMD: SOT-23; Value: C9014
R14-R19 = RESISTOR SMD: Resistor

## Nets that join several sheets
+3.3V: Power (5 pins), ESP32 (7 pins), USB (C5.1 C6.1 U1.4 U1.16), Input (11 pins), Output (B3.1 D2.2 P5.7)
+5V: Power (6 pins), Input (P3.1), Output (8 pins)
GND: Power (22 pins), ESP32 (10 pins), USB (9 pins), Input (18 pins), Output (6 pins)
Net*1_3: ESP32 (*1.3 B1.2 C1.2 R3.2), USB (Q1.3)
Net*1_6: ESP32 (*1.6), Input (R11.1 U6.1)
Net*1_7: ESP32 (*1.7), Input (P3.2 R13.1)
Net*1_11: ESP32 (*1.11), Output (IC1.4)
Net*1_12: ESP32 (*1.12), Output (IC1.3)
Net*1_13: ESP32 (*1.13), Output (P5.1)
Net*1_14: ESP32 (*1.14), Output (IC1.1)
Net*1_16: ESP32 (*1.16), Output (P5.4)
Net*1_25: ESP32 (*1.25 B2.2 C2.2 R4.2), USB (Q2.3)
Net*1_26: ESP32 (*1.26), Output (P5.3)
Net*1_27: ESP32 (*1.27), Output (R15.1)
Net*1_28: ESP32 (*1.28), Output (IC1.2)
Net*1_29: ESP32 (*1.29), Output (P5.2)
Net*1_30: ESP32 (*1.30), Output (P5.6)
Net*1_31: ESP32 (*1.31), Output (R14.1)
Net*1_33: ESP32 (*1.33 R2.2), Input (U3.5 U4.15 U5.15)
Net*1_34: ESP32 (*1.34), USB (U1.2)
Net*1_35: ESP32 (*1.35), USB (U1.3)
Net*1_36: ESP32 (*1.36 R1.2), Input (U3.6 U4.14 U5.16)
Net*1_37: ESP32 (*1.37), Output (P5.5)
NetC7_1: Power (SW1.3 SW1.4), USB (5 pins)